# Altium schematic sheet BMU.SchDoc
size Legal; SheetNumber: 1; SheetTotal: 1
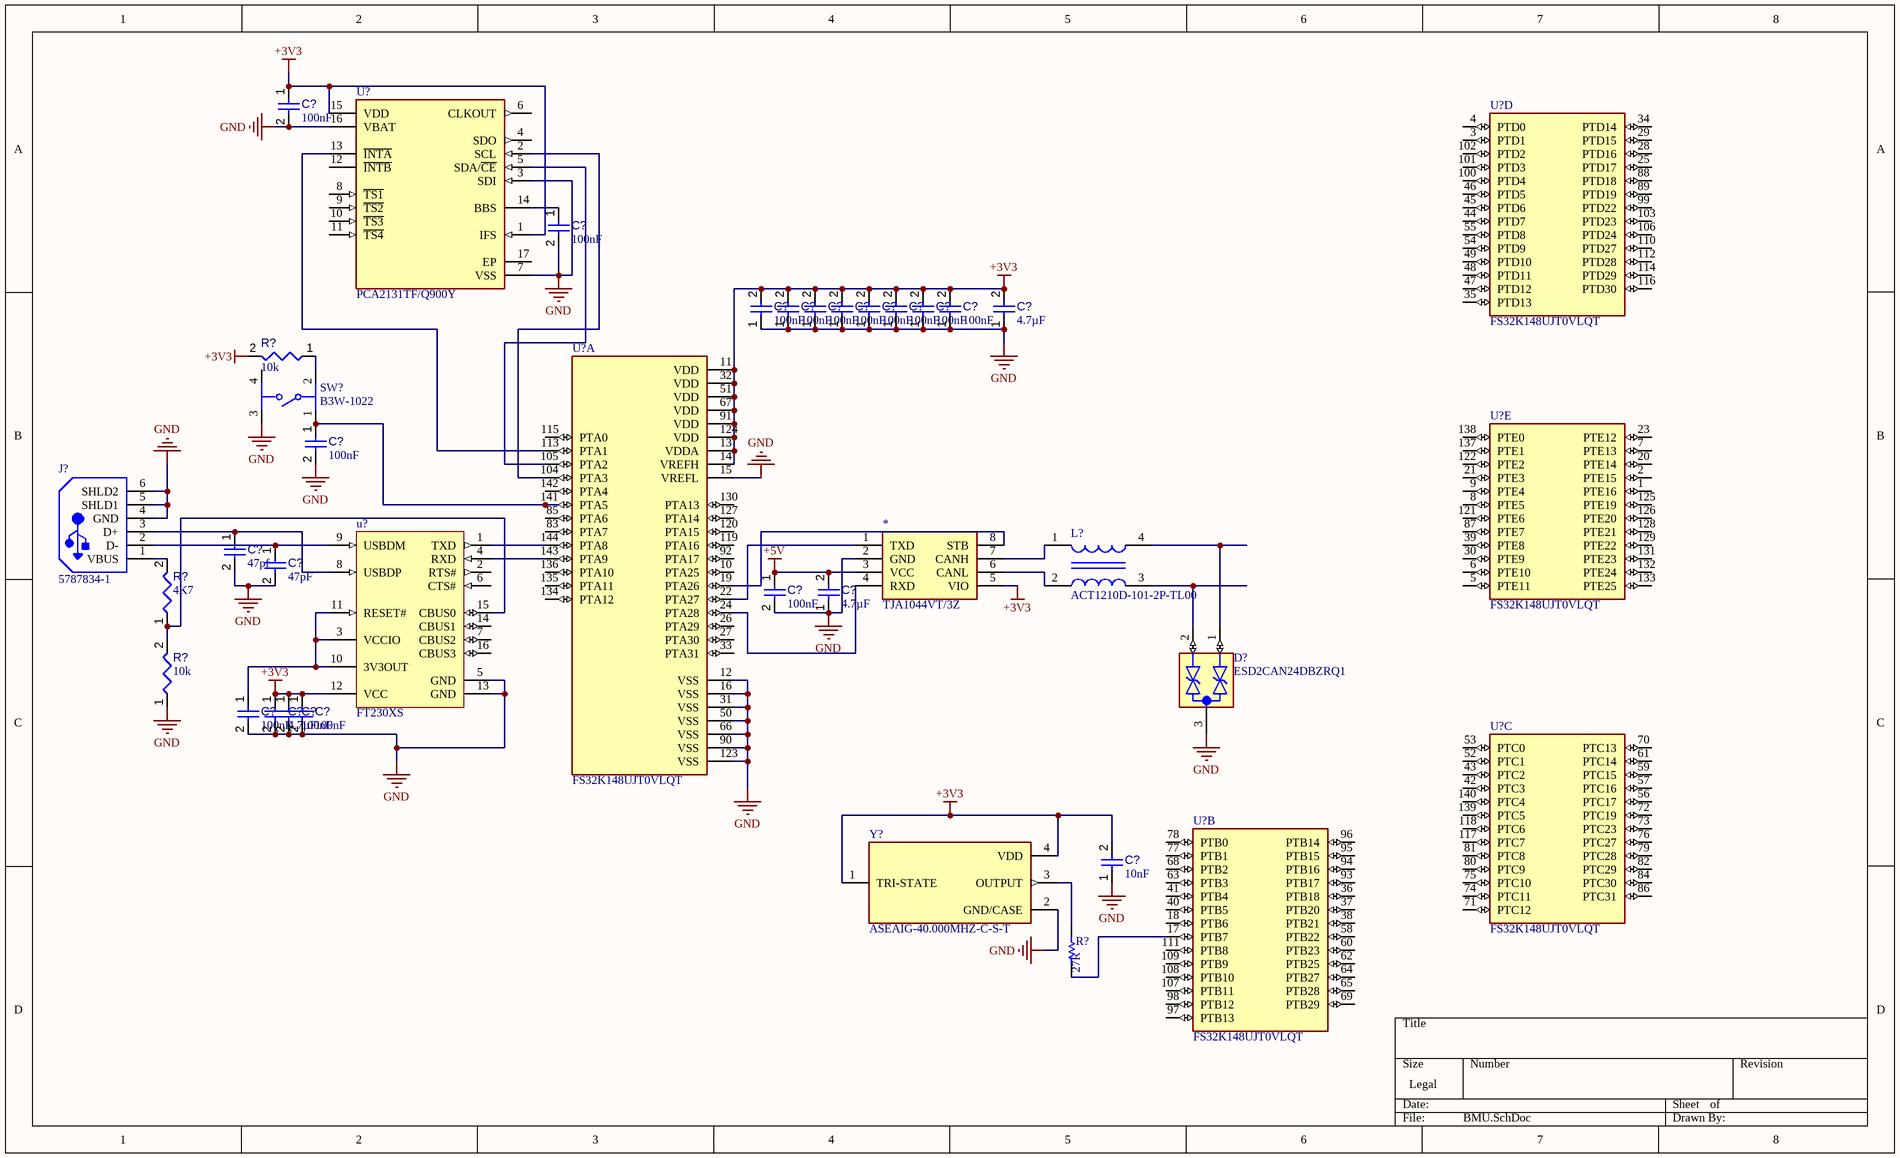
[diagram p0: BMU.SchDoc]

## Parts
(Parts that share a designator on the sheet are numbered #1, #2 ... from top to bottom, then left to right.)
*  TJA1044VT/3Z  [TJA1044VT_3Z-Footprint-1]
C?#1  value 100nF  [CAPC2013X95X50LL10T25]  (hidden comment: Capacitor 100 nF +/-10% 50 V 0805)
C?#2  value 100nF  [CAPC2013X95X50LL10T25]  (hidden comment: Capacitor 100 nF +/-10% 50 V 0805)
C?#3  value 100nF  [CAPC2013X95X50LL10T25]  (hidden comment: Capacitor 100 nF +/-10% 50 V 0805)
C?#4  value 100nF  [CAPC2013X95X50LL10T25]  (hidden comment: Capacitor 100 nF +/-10% 50 V 0805)
C?#5  value 100nF  [CAPC2013X95X50LL10T25]  (hidden comment: Capacitor 100 nF +/-10% 50 V 0805)
C?#6  value 100nF  [CAPC2013X95X50LL10T25]  (hidden comment: Capacitor 100 nF +/-10% 50 V 0805)
C?#7  value 100nF  [CAPC2013X95X50LL10T25]  (hidden comment: Capacitor 100 nF +/-10% 50 V 0805)
C?#8  value 100nF  [CAPC2013X95X50LL10T25]  (hidden comment: Capacitor 100 nF +/-10% 50 V 0805)
C?#9  value 100nF  [CAPC2013X95X50LL10T25]  (hidden comment: Capacitor 100 nF +/-10% 50 V 0805)
C?#10  value 100nF  [CAPC2013X95X50LL10T25]  (hidden comment: Capacitor 100 nF +/-10% 50 V 0805)
C?#11  value 4.7µF  [CAPC0603(1608)100_L]  (hidden comment: Capacitor 4.7µF +/-20% 10V 0603)
C?#12  value 100nF  [CAPC2013X95X50LL10T25]  (hidden comment: Capacitor 100 nF +/-10% 50 V 0805)
C?#13  value 47pf  [CAPC2013X95X50LL10T25]  (hidden comment: Capacitor 100 nF +/-10% 50 V 0805)
C?#14  value 47pF  [CAPC2013X95X50LL10T25]  (hidden comment: Capacitor 100 nF +/-10% 50 V 0805)
C?#15  value 100nF  [CAPC2013X95X50LL10T25]  (hidden comment: Capacitor 100 nF +/-10% 50 V 0805)
C?#16  value 4.7µF  [CAPC0603(1608)100_L]  (hidden comment: Capacitor 4.7µF +/-20% 10V 0603)
C?#17  value 100nF  [CAPC2013X95X50LL10T25]  (hidden comment: Capacitor 100 nF +/-10% 50 V 0805)
C?#18  value 4.7µF  [CAPC0603(1608)100_L]  (hidden comment: Capacitor 4.7µF +/-20% 10V 0603)
C?#19  value 100nF  [CAPC2013X95X50LL10T25]  (hidden comment: Capacitor 100 nF +/-10% 50 V 0805)
C?#20  value 100nF  [CAPC2013X95X50LL10T25]  (hidden comment: Capacitor 100 nF +/-10% 50 V 0805)
C?#21  value 10nF  [CAPC0402(1005)60_L]  (hidden comment: Capacitor 10nF +/-20% 50V 0402)
D?  ESD2CAN24DBZRQ1  [SOT95P237X112-3N]
J?  5787834-1  [TECO-5787834-1_V]
L?  ACT1210D-101-2P-TL00  [FP-ACT1210D-MFG]
R?#1  value 10k  [RESC0402(1005)_L]  (hidden comment: 10KR2F)
R?#2  value 4K7  [RESC0402(1005)_L]  (hidden comment: 10KR2F)
R?#3  value 10k  [RESC0402(1005)_L]  (hidden comment: 10KR2F)
R?#4  value 27R  (hidden comment: Resistor)
SW?  B3W-1022  [FP-B3W-1022-MFG]
U?#1  PCA2131TF/Q900Y  [FP-SOT1992-1_DD-MFG]
U?#2  FS32K148UJT0VLQT  [QFP50P2200X2200X160-144N]  (part D of 5)
U?#3  FS32K148UJT0VLQT  [QFP50P2200X2200X160-144N]  (part A of 5)
U?#4  FS32K148UJT0VLQT  [QFP50P2200X2200X160-144N]  (part E of 5)
u?#5  FT230XS  [FTDI-SSOP-16_L]
U?#6  FS32K148UJT0VLQT  [QFP50P2200X2200X160-144N]  (part C of 5)
U?#7  FS32K148UJT0VLQT  [QFP50P2200X2200X160-144N]  (part B of 5)
Y?  ASEAIG-40.000MHZ-C-S-T  [XTAL_ASEAIG-40.000MHZ-C-S-T]

## Nets
+3V3: *.5(VIO) C?#1.1 C?#3.2 C?#4.2 C?#5.2 C?#6.2 C?#7.2 C?#8.2 C?#9.2 C?#10.2 C?#11.2 C?#18.1 C?#19.1 C?#20.1 C?#21.2 R?#1.2 U?#1.1(IFS) U?#1.15(VDD) U?#3.11(VDD) U?#3.13(VDDA) U?#3.14(VREFH) U?#3.32(VDD) U?#3.51(VDD) U?#3.67(VDD) U?#3.91(VDD) U?#3.124(VDD) u?#5.12(VCC) Y?.1(TRI-STATE) Y?.4(VDD)
+5V: *.3(VCC) C?#15.1 C?#16.2
GND: *.2(GND) C?#1.2 C?#2.2 C?#3.1 C?#4.1 C?#5.1 C?#6.1 C?#7.1 C?#8.1 C?#9.1 C?#10.1 C?#11.1 C?#12.2 C?#13.2 C?#14.2 C?#15.2 C?#16.1 C?#17.2 C?#18.2 C?#19.2 C?#20.2 C?#21.1 D?.3(GND) J?.4(GND) J?.5(SHLD1) J?.6(SHLD2) R?#3.1 SW?.3 U?#1.3(SDI) U?#1.7(VSS) U?#1.16(VBAT) U?#3.12(VSS) U?#3.15(VREFL) U?#3.16(VSS) U?#3.31(VSS) U?#3.50(VSS) U?#3.66(VSS) U?#3.90(VSS) U?#3.123(VSS) u?#5.5(GND) u?#5.13(GND) Y?.2(GND/CASE)
Net*_1: *.1(TXD) U?#3.22(PTA27)
Net*_4: *.4(RXD) U?#3.24(PTA28)
Net*_6: *.6(CANL) L?.2
Net*_7: *.7(CANH) L?.1
Net*_8: *.8(STB) U?#3.19(PTA26)
NetC?#2_1: C?#2.1 U?#1.14(BBS)
NetC?#12_1: C?#12.1 SW?.1 U?#3.141(PTA5)
NetC?#13_1: C?#13.1 J?.3(D+) u?#5.8(USBDP)
NetC?#14_1: C?#14.1 J?.2(D-) u?#5.9(USBDM)
NetC?#17_1: C?#17.1 u?#5.3(VCCIO) u?#5.10(3V3OUT) u?#5.11(RESET#)
NetD?_1: D?.1(IO1) L?.4
NetD?_2: D?.2(IO2) L?.3
NetJ?_1: J?.1(VBUS) R?#2.2
NetR?#1_1: R?#1.1 SW?.2
NetR?#2_1: R?#2.1 R?#3.2 u?#5.15(CBUS0)
NetR?#4_1: R?#4.1 Y?.3(OUTPUT)
NetR?#4_2: R?#4.2 U?#7.17(PTB7)
NetU?#1_2: U?#1.2(SCL) U?#3.104(PTA3)
NetU?#1_5: U?#1.5(SDA/~{CE}) U?#3.105(PTA2)
NetU?#1_13: U?#1.13(~{INTA}) U?#3.113(PTA1)
NetU?#3_143: U?#3.143(PTA9) u?#5.4(RXD)
NetU?#3_144: U?#3.144(PTA8) u?#5.1(TXD)

Not connected (* = marked no-connect by the designer): SW? 4; U?#1 4(SDO) 6(CLKOUT) 8(~{TS1}) 9(~{TS2}) 10(~{TS3}) 11(~{TS4}) 12(~{INTB}) 17(EP); U?#2 3(PTD1) 4(PTD0) 25(PTD17) 28(PTD16) 29(PTD15) 34(PTD14) 35(PTD13) 44(PTD7) 45(PTD6) 46(PTD5) 47(PTD12) 48(PTD11) 49(PTD10) 54(PTD9) 55(PTD8) 88(PTD18) 89(PTD19) 99(PTD22) 100(PTD4) 101(PTD3) 102(PTD2) 103(PTD23) 106(PTD24) 110(PTD27) 112(PTD28) 114(PTD29) 116(PTD30); U?#3 10(PTA25) 26(PTA29) 27(PTA30) 33(PTA31) 83(PTA7) 85(PTA6) 92(PTA17) 115(PTA0) 119(PTA16) 120(PTA15) 127(PTA14) 130(PTA13) 134(PTA12) 135(PTA11) 136(PTA10) 142(PTA4); U?#4 1(PTE16) 2(PTE15) 5(PTE11) 6(PTE10) 7(PTE13) 8(PTE5) 9(PTE4) 20(PTE14) 21(PTE3) 23(PTE12) 30(PTE9) 39(PTE8) 87(PTE7) 121(PTE6) 122(PTE2) 125(PTE19) 126(PTE20) 128(PTE21) 129(PTE22) 131(PTE23) 132(PTE24) 133(PTE25) 137(PTE1) 138(PTE0); u?#5 2(RTS#) 6(CTS#) 7(CBUS2) 14(CBUS1) 16(CBUS3); U?#6 42(PTC3) 43(PTC2) 52(PTC1) 53(PTC0) 56(PTC17) 57(PTC16) 59(PTC15) 61(PTC14) 70(PTC13) 71(PTC12) 72(PTC19) 73(PTC23) 74(PTC11) 75(PTC10) 76(PTC27) 79(PTC28) 80(PTC9) 81(PTC8) 82(PTC29) 84(PTC30) 86(PTC31) 117(PTC7) 118(PTC6) 139(PTC5) 140(PTC4); U?#7 18(PTB6) 36(PTB18) 37(PTB20) 38(PTB21) 40(PTB5) 41(PTB4) 58(PTB22) 60(PTB23) 62(PTB25) 63(PTB3) 64(PTB27) 65(PTB28) 68(PTB2) 69(PTB29) 77(PTB1) 78(PTB0) 93(PTB17) 94(PTB16) 95(PTB15) 96(PTB14) 97(PTB13) 98(PTB12) 107(PTB11) 108(PTB10) 109(PTB9) 111(PTB8)

## Library data of the parts
* = CMP-00004-1: CAN - Controller Area Network High-Speed 40Kbps 4.75V to 5.25V 8-Pin SOIC T/R; Max Supply Current: 110mA; Data Rate: 5Mbps; Number of Circuits: 1; Nominal Supply Voltage (DC): 5V; Length: 4.9mm; Schedule B: 8542390000, 8542390000; Number of Terminals: 8; Terminal Pitch: 1.27mm; Ratings: AEC-Q100; Harmonized Tariff Schedule (HTS) Code: 8542.39.00.01; Number of Channels: 1; Min Operating Temperature: -40°C; Height - Seated (Max): 1.75mm; Country of Origin: Thailand; Introduction Date: 2018-05-03; Number of Transceivers: 1; REACH SVHC: Unaffected; China RoHS: Compliant; RoHS: Compliant; Max Operating Temperature: 150°C; Lifecycle Status: NRND; Case/Package: SOP; Width: 3.9mm
C?#1-C?#10 C?#12-C?#15 C?#17 C?#19 C?#20 = CMP-001-00018-6: Chip Capacitor, 100 nF, +/- 10%, 50 V, 0805 (2012 Metric); Capacitor Type: Ceramic; Voltage Rating: 50V; Pins: 2; Max Operating Temperature: 125°C; Min Operating Temperature: -55°C; Mounting Technology: SM; Case/Package: 0805; RoHS Compliant: True; Tolerance: 10%
C?#11 C?#16 C?#18 = CMP-001-00076-4: Chip Capacitor, 4.7µF +/-20%, 10V, 0603, Thickness 1 mm; Tolerance: 10%; Mounting Technology: SMT; Case/Package: 0603; Pins: 2; Min Operating Temperature: -55°C; Max Operating Temperature: 85°C; Voltage Rating: 10V
C?#21 = CMP-001-00069-3: Chip Capacitor, 10nF +/-20%, 50V, 0402, Thickness 0.6 mm; Tolerance: 5%; Max Operating Temperature: 85°C; Pins: 2; Case/Package: 0402; Voltage Rating: 50V; Min Operating Temperature: -55°C; Mounting Technology: SMT
D? = CMP-004-00031-1: Automotive, dual, 3-pF, ±24-V, ±30-kV ESD protection diode for in-vehicle networks; MF: Texas Instruments; Source: ESD2CAN24DBZRQ1.SchLib; Check_prices: https://www.snapeda.com/parts/ESD2CAN24DBZRQ1/Texas+Instruments/view-part/?ref=eda; Design Item ID: ESD2CAN24DBZRQ1; MP: ESD2CAN24DBZRQ1; SnapEDA_Link: https://www.snapeda.com/parts/ESD2CAN24DBZRQ1/Texas+Instruments/view-part/?ref=snap; Component Type: Standard; Case/Package: SOT-23 Texas Instruments; Pins: 3; Value: *
J? = CMP-2000-07485-1: USB-B Receptacle Connector, Height 15.62 mm, -55 to 85 degC, RoHS, Tray; Manufacturer: TE Connectivity; Number of Positions: 4; Number of Ports: 1; Pitch: 2.5mm; Plating: Bright; Tail Length: 3.01mm; Current Rating: 1A; Plating Thickness: 0.76um; Voltage Rating (AC): 30V; PCB Thickness: 1.57mm; Insulation Resistance: 1GR; Datasheet Version: Rev. A4, 07/2017; REACH SVHC: NoSVHC; Package Description: 4-Pin Through Hole Device, Body 12.03 x 11.46 mm, Height 15.62 mm; Colour: Black; Gender: Receptacle; Packaging: Tray; Housing Material: Thermoplastic; Package Quantity: 144; Contact Plating: Gold; Contact Material: CopperAlloy; Housing Colour: Black; ELV: Compliant; Connector Type: Receptacle; Mount: Vertical; Max Operating Temperature: 85degC; Datasheet URL: http://www.te.com/commerce/DocumentDelivery/DDEController?Action=srchrtrv&DocNm=5787834&DocType=Customer+Drawing&DocLang=English; Manufacturer URL: http://www.te.com/; Radiation Hardening: No; Mounting Technology: ThroughHole; RoHSCompliant: true; Length: 12.03mm; Number of Contacts: 4; Lead Free: LeadFree; Number of Terminals: 4; Orientation: Vertical; Flammability Rating: UL94V-0; Min Operating Temperature: -55degC; Termination: ThroughHole; Depth: 11.46mm; Package Reference: 5787834-1
L? = CMP-08256-000008-1: CMC 100UH 150MA 2LN SMD AEC-Q200
R?#1-R?#3 = CMP-009-00066-2: 10K 0.063W 1% 0402 (1005 Metric)  SMD; Power: 63mW; Case/Package: 0402; Mounting Technology: SMT; Pins: 2; Tolerance: 1%
R?#4 = Resistor: TC1: 0; SimulationGenericComponent: True; TC2: 0
SW? = CMP-08834-000055-1: SWITCH TACTILE SPST-NO 0.05A 24V; Operating Force: 230gf; Switch Function: Off-Mom; Switch Travel: 0.25mm; Throw Configuration: SPST; Actuator Type: Standard; Illumination Type: Non-Illuminated; Ratings: IP67; Mechanical Life: 1000000Cycles; Packaging: Bulk; Termination: PC Pin; Max Operating Temperature: 70°C; RoHS Compliant: Yes; Mount: Through Hole; Min Operating Temperature: -25°C
U?#1 = CMP-10083-000021-1: IC RTC W/XTAL AUTO HLSON16
U?#2-U?#4 U?#6 U?#7 = CMP-031-00006-1: ARMÂ® CortexÂ®-M4F S32K Microcontroller IC 32-Bit Single-Core 112MHz 2MB (2M x 8) FLASH 144-LQFP (20x20); MF: NXP Semiconductors; Case/Package: LQFP-144 NXP; MP: FS32K148UJT0VLQT; Pins: 144; SnapEDA_Link: https://www.snapeda.com/parts/FS32K148UJT0VLQT/NXP+Semiconductors/view-part/?ref=snap; Design Item ID: FS32K148UJT0VLQT; Check_prices: https://www.snapeda.com/parts/FS32K148UJT0VLQT/NXP+Semiconductors/view-part/?ref=eda; Component Type: Standard; Value: *; Purchase-URL: https://pricing.snapeda.com/search/part/FS32K148UJT0VLQT/?ref=eda; Price: None; Availability: In Stock; Source: FS32K148UJT0VLQT.SchLib
u?#5 = CMP-2000-06288-1: USB to Basic UART IC, 2.97 to 5.5 V, -40 to 85 degC, 16-Pin SSOP, RoHS; Manufacturer: FTDI; Data Rate: 3Mbaud; USB Standard: USB2.0; USB Type: Transceiver; No. of Pins: 16Pins; Supply Voltage Max: 5.5V; SVHC: NoSVHC(17-Dec-2015); Supply Voltage Min: 2.97V; MSL: MSL3-168hours; Datasheet Version: Rev. 1.4, 05/2016; Interface Case Style: SSOP; Datasheet URL: http://www.ftdichip.com/Support/Documents/DataSheets/ICs/DS_FT230X.pdf; Packaging: CutTape; Package Description: 16-Pin Shrink Small Outline Package Integrated Circuit, Body 4.9 x 3.9 mm, Pitch 0.635 mm; Operating Temperature Min: -40°C; Mounting Technology: SurfaceMount; Package Reference: SSOP-16; Manufacturer URL: http://www.ftdichip.com/; Product Range: -; Operating Temperature Max: 85°C; No. of Ports: -
Y? = CMP-008-000000-1: 40 MHz XO (Standard) CMOS Oscillator 3.3V Enable/Disable 4-SMD, No Lead; MF: Abracon LLC; Design Item ID: ASEAIG-40.000MHZ-C-S-T; Component Type: Standard; MP: ASEAIG-40.000MHZ-C-S-T; SnapEDA_Link: https://www.snapeda.com/parts/ASEAIG-40.000MHZ-C-S-T/Abracon+LLC/view-part/?ref=snap; Value: *; Package: None; Source: ASEAIG-40.000MHZ-C-S-T.SchLib; Pin Count: 4; Check_prices: https://www.snapeda.com/parts/ASEAIG-40.000MHZ-C-S-T/Abracon+LLC/view-part/?ref=eda